# Altium schematic sheet Sortie.SchDoc
size A; SheetNumber: 1; SheetTotal: 1; SPICEModelCacheCCUHFSGS: <root> / <DocumentId>CCUHFSGS</DocumentId> / </root>
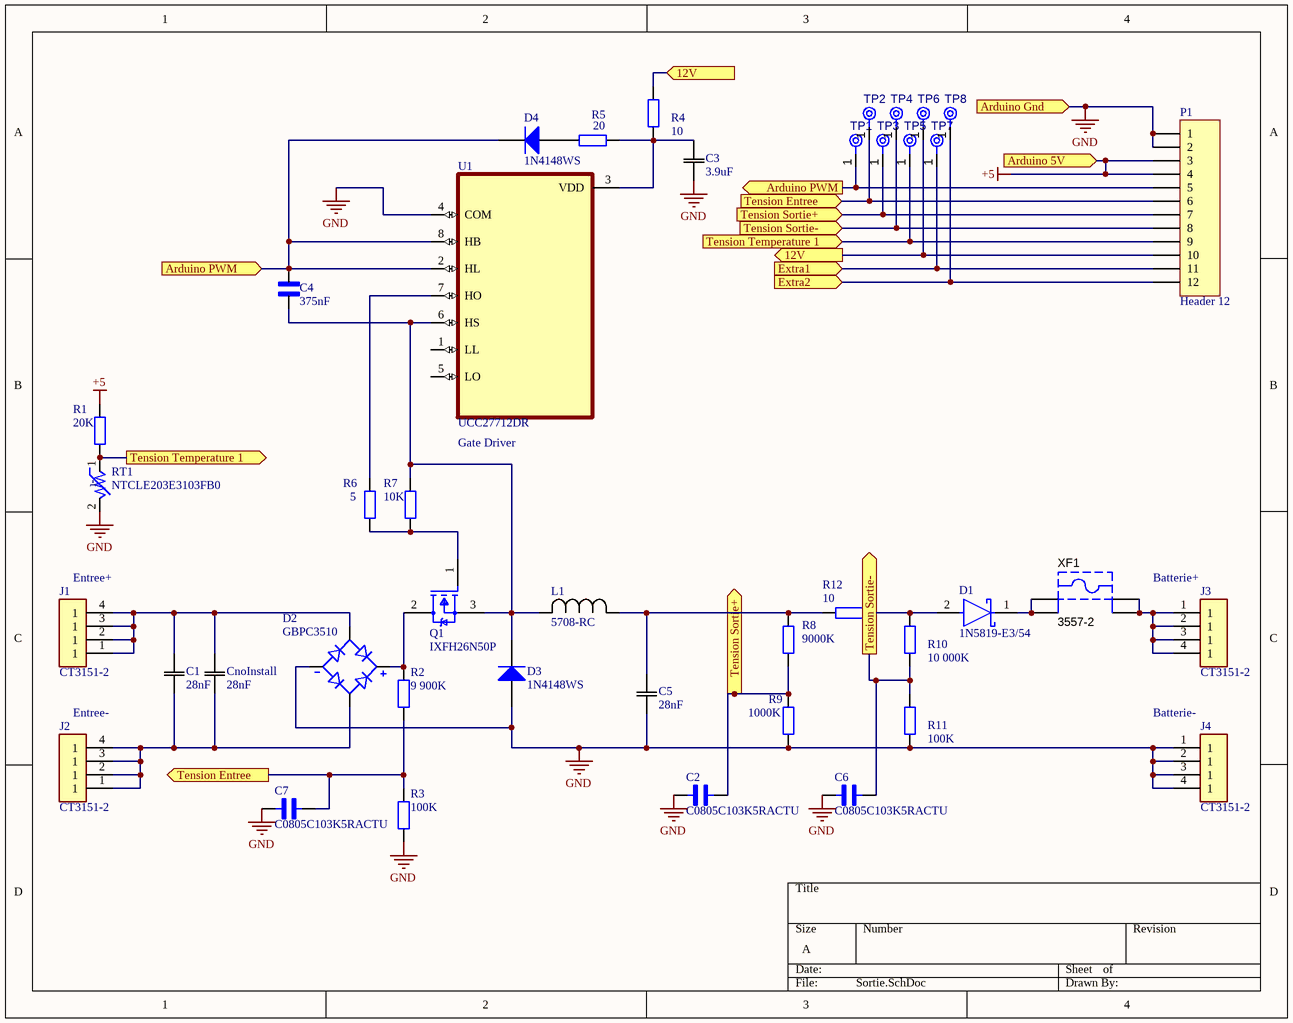
[diagram p0: Sortie.SchDoc]

## Parts
C1  28nF  [CAPC17595_95N_KEM]
C2  C0805C103K5RACTU  [CAPC2012X88N]
C3  3.9uF  [CAP_L_10X12P5_RUB]
C4  375nF  [CAPRB500W50L550T350H600]
C5  28nF  [CAPC17595_95N_KEM]
C6  C0805C103K5RACTU  [CAPC2012X88N]
C7  C0805C103K5RACTU  [CAPC2012X88N]
CnoInstall  28nF  [CAPC17595_95N_KEM]
D1  1N5819-E3/54  [FP-1N5819-E3-54-MFG]
D2  GBPC3510  [DIOB_GBPC3510]
D3  1N4148WS  [FAIR-SOD-323_V]
D4  1N4148WS  [FAIR-SOD-323_V]
J1  CT3151-2  [CALTEST_CT3151-2]
J2  CT3151-2  [CALTEST_CT3151-2]
J3  CT3151-2  [CALTEST_CT3151-2]
J4  CT3151-2  [CALTEST_CT3151-2]
L1  5708-RC  [IND_BOURNS_5708]
P1  Header 12  [HDR1X12]
Q1  IXFH26N50P  [FP-PG-TO220-3-MFG]
R1  value 20K  [AXIAL-0.4]  (hidden comment: Res2)
R2  value 9 900K  [AXIAL-0.4]  (hidden comment: Res2)
R3  value 100K  [AXIAL-0.4]  (hidden comment: Res2)
R4  value 10  [AXIAL-0.4]  (hidden comment: Res2)
R5  value 20  [AXIAL-0.4]  (hidden comment: Res2)
R6  value 5  [AXIAL-0.4]  (hidden comment: Res2)
R7  value 10K  [AXIAL-0.4]  (hidden comment: Res2)
R8  value 9000K  [AXIAL-0.4]  (hidden comment: Res2)
R9  value 1000K  [AXIAL-0.4]  (hidden comment: Res2)
R10  value 10 000K  [AXIAL-0.4]  (hidden comment: Res2)
R11  value 100K  [AXIAL-0.4]  (hidden comment: Res2)
R12  value 10  [AXIAL-0.4]  (hidden comment: Res2)
RT1  NTCLE203E3103FB0  [VARRB254W40L360T300H900]
TP1  TPAD6R  [TP06R]  (value not drawn)  (no BOM)
TP2  TPAD6R  [TP06R]  (value not drawn)  (no BOM)
TP3  TPAD6R  [TP06R]  (value not drawn)  (no BOM)
TP4  TPAD6R  [TP06R]  (value not drawn)  (no BOM)
TP5  TPAD6R  [TP06R]  (value not drawn)  (no BOM)
TP6  TPAD6R  [TP06R]  (value not drawn)  (no BOM)
TP7  TPAD6R  [TP06R]  (value not drawn)  (no BOM)
TP8  TPAD6R  [TP06R]  (value not drawn)  (no BOM)
U1  UCC27712DR  [SOIC127P599X175-8N]
XF1  3557-2  [KSTN-3557-2]

## Ports
12V (in, see Sortie[3A]), 12V (out, see Sortie[3A]), Arduino 5V (in), Arduino Gnd (in), Arduino PWM (in, see Sortie[3A]), Arduino PWM (out, see Sortie[1B]), Extra1 (in), Extra2 (in), Tension Entree (in, see Sortie[1D]), Tension Entree (out, see Sortie[3A]), Tension Sortie+ (in, see Sortie[3C]), Tension Sortie+ (out, see Sortie[3A]), Tension Sortie- (in, see Sortie[3C]), Tension Sortie- (out, see Sortie[3A]), Tension Temperature 1 (in, see Sortie[1B]), Tension Temperature 1 (out, see Sortie[3A])

## Nets
+5: P1.3 P1.4 R1.2 ; port Arduino 5V
GND: C2.2 C3.1 C5.1 C6.2 C7.2 D2.NEG D3.1(A) J4.1 J4.2(1) J4.3(1) J4.4(1) P1.1 P1.2 R3.1 R9.1 R11.2 RT1.2 U1.4(COM) ; port Arduino Gnd
12V: P1.10 R4.1 TP6.1(TP) ; port 12V
Arduino PWM: C4.2 D4.2(K) P1.5 TP1.1(TP) U1.2(HL) U1.8(HB) ; port Arduino PWM
Extra1: P1.11 TP7.1(TP) ; port Extra1
Extra2: P1.12 TP8.1(TP) ; port Extra2
Tension Entree: C7.1 P1.6 R2.1 R3.2 TP2.1(TP) ; port Tension Entree
Tension Sortie+: C2.1 P1.7 R8.2 R9.2 TP3.1(TP) ; port Tension Sortie+
Tension Sortie-: C6.1 P1.8 R10.2 R11.1 TP4.1(TP) ; port Tension Sortie-
Tension Temperature 1: P1.9 R1.1 RT1.1 TP5.1(TP) ; port Tension Temperature 1
NetC1_1: C1.1 CnoInstall.1 D2.AC1 J2.1 J2.2(1) J2.3(1) J2.4(1)
NetC1_2: C1.2 CnoInstall.2 D2.AC2 J1.1 J1.2(1) J1.3(1) J1.4(1)
NetC3_2: C3.2 R4.2 R5.2 U1.3(VDD)
NetC4_1: C4.1 D3.2(K) L1.2 Q1.3(SOURCE) R7.2 U1.6(HS)
NetC5_2: C5.2 L1.1 R8.1 R12.2
NetD1_1: D1.1(C) XF1.1 XF1.2
NetD1_2: D1.2(A) R10.1 R12.1
NetD2_POS: D2.POS Q1.2(DRAIN) R2.2
NetD4_1: D4.1(A) R5.1
NetJ3_1: J3.1 J3.2(1) J3.3(1) J3.4(1) XF1.3 XF1.4
NetQ1_1: Q1.1(GATE) R6.1 R7.1
NetR6_2: R6.2 U1.7(HO)

Not connected (* = marked no-connect by the designer): U1 1(LL) 5(LO)

## Notes on the sheet
- Gate Driver
- (near J1) Entree+
- Batterie+
- (near J2) Entree-
- (near J4) Batterie-
- (in symbol NTCLE203E3103FB0) -t

## Library data of the parts
C1 C5 CnoInstall = C0603C473K5RACTU: SMD Comm X7R, Ceramic, 0.047 uF, 10%, 50 VDC, X7R, SMD, MLCC, Temperature Stable, Class II, 0603; Manufacturer_Name: Kemet; Copyright: Copyright (C) 2026 Ultra Librarian. All rights reserved.; Manufacturer_Part_Number: C0603C473K5RACTU
C2 C6 C7 = C0805C103K5RACTU: Capacitor;Ceramic;Cap;.010uF;Tol+10%;SMT;Vol-Rtg 50V;X7R;TR | KEMET C0805C103K5RACTU; SnapEDA_Link: https://www.snapeda.com/parts/C0805C103K5RACTU/KEMET/view-part/?ref=snap; Package: 805-2 KEMET; Value: *; MF: KEMET; MP: C0805C103K5RACTU; Check_prices: https://www.snapeda.com/parts/C0805C103K5RACTU/KEMET/view-part/?ref=eda
C3 = 400LEX3.9MEFC10X12.5: No Description Available; Manufacturer_Name: Rubycon; Copyright: Copyright (C) 2026 Ultra Librarian. All rights reserved.; Manufacturer_Part_Number: 400LEX3.9MEFC10X12.5
C4 = FG26X7R1E106KRT00: Cap Ceramic 10uF 25V X7R 10% Radial 5mm 125C; MF: TDK; SnapEDA_Link: https://www.snapeda.com/parts/FG26X7R1E106KRT00/TDK/view-part/?ref=snap; Package: Radial TDK; Value: *; MP: FG26X7R1E106KRT00; Check_prices: https://www.snapeda.com/parts/FG26X7R1E106KRT00/TDK/view-part/?ref=eda
D1 = CMP-02539-000037-2: DIODE SCHOTTKY 40V 1A DO204AL; Capacitance: 110pF; Element Configuration: Single; Peak Non-Repetitive Surge Current: 25A; Forward Voltage: 900mV; Polarity: Standard; Peak Reverse Current: 1mA; Max Operating Temperature: 125°C; Forward Current: 1A; Package Quantity: 1; Average Rectified Current: 1A; Voltage: 40V; Radiation Hardening: No; Current: 1A; Max Reverse Voltage (DC): 40V; Height: 2.7mm; Output Current: 1A; Lead Free: Lead Free; Diameter: 2.7mm; Min Operating Temperature: -65°C; Max Repetitive Reverse Voltage (Vrrm): 40V; Number of Pins: 2; Width: 2.7mm; Length: 5.2mm; Current Rating: 1A; Packaging: Tape and Reel; Mount: Through Hole; Max Forward Surge Current (Ifsm): 25A; Voltage Rating (DC): 40V
D2 = GBPC3510: Bridge Rectifier Single Phase Standard 1kV QC Terminal GBPC; MF: Fairchild Semiconductor; Package: 4-4 Fairchild Semiconductor; Purchase-URL: https://pricing.snapeda.com/search/part/GBPC3510/?ref=eda; MP: GBPC3510; SnapEDA_Link: https://www.snapeda.com/parts/GBPC3510/Fairchild+Semiconductor/view-part/?ref=snap; Value: *; Availability: In Stock; Price: None; Check_prices: https://www.snapeda.com/parts/GBPC3510/Fairchild+Semiconductor/view-part/?ref=eda
D3 D4 = CMP-004-00001-2: Small Signal Diode, 75 V, 0.15 A, -55 to 150 degC, 2-Pin SOD-323, RoHS, Tape and Reel; Manufacturer: Fairchild; Recovery Time: 4ns; Forward Voltage: 1V; Peak Reverse Current: 5uA; Forward Current: 150mA; Capacitance: -323f; Datasheet URL: https://www.fairchildsemi.com/datasheets/1N/1N4148WS.pdf; Package Reference: SOD-323; Package Description: 2-Pin Small Outline Diode Flat Lead, Body 1.7 x 1.25 mm; Case/Package: SOD-323; Mounting Technology: SM; Manufacturer URL: https://www.fairchildsemi.com/; Pins: 2; Packaging: TapeandReel; Package Quantity: 3000; Min Operating Temperature: -55°C; RoHS Compliant: True; Max Operating Temperature: 150°C; Datasheet Version: Rev. 1.2, 03/2015
J1-J4 = CT3151-2: Banana Jack Connector Standard Banana Solder Red; MF: Cal Test; SnapEDA_Link: https://www.snapeda.com/parts/CT3151-2/Cal+Test+Electronics/view-part/?ref=snap; Package: None; Value: *; MP: CT3151-2; Check_prices: https://www.snapeda.com/parts/CT3151-2/Cal+Test+Electronics/view-part/?ref=eda
L1 = 5708-RC: 0.4mH; Manufacturer_Name: Bourns Electronics; Copyright: Copyright (C) 2026 Ultra Librarian. All rights reserved.; Manufacturer_Part_Number: 5708-RC
P1 = Header 12: Header, 12-Pin; LatestRevisionDate: 17-Jul-2002; LatestRevisionNote: Re-released for DXP Platform.; Publisher: Altium Limited
Q1 = CMP-32901-000547-1: MOSFET N-CH 55V 29A TO220AB; Rise Time: 49ns; Turn-On Delay Time: 7ns; Input Capacitance: 700pF; Drain to Source Resistance: 40mR; Turn-Off Delay Time: 31ns; Power Dissipation: 68W; Gate to Source Voltage (Vgs): 20V; Element Configuration: Single; Threshold Voltage: 4V; Packaging: Rail/Tube; Number of Pins: 3; Height: 0.6inch; Case/Package: TO-220; Min Operating Temperature: -55°C; Max Operating Temperature: 175°C; RoHS Compliant: Yes; Width: 0.185inch; Lead Free: Lead Free; Contact Plating: Tin; Drain to Source Breakdown Voltage: 55V; Length: 0.414inch; Mount: Through Hole; Max Power Dissipation: 68W; Halogen Free: Not Halogen Free; Max Dual Supply Voltage: 55V; Rds On Max: 40mR; Continuous Drain Current (ID): 29A; Drain to Source Voltage (Vdss): 55V; REACH SVHC: No SVHC
R1-R12 = Res2: Resistor; LatestRevisionDate: 17-Jul-2002; LatestRevisionNote: Re-released for DXP Platform.; PackageDescription: Axial Device, Thru-Hole; 2 Leads; 0.4 in Pin Spacing; PackageReference: AXIAL-0.4; Published: 8-Jun-2000; Publisher: Altium Limited
RT1 = NTCLE203E3103FB0: NTC Thermistors,NTC Ni 0.4 lead 10K 1% bulk e3 | Vishay Dale NTCLE203E3103FB0; SnapEDA_Link: https://www.snapeda.com/parts/NTCLE203E3103FB0/Vishay/view-part/?ref=snap; Package: None; Value: *; MF: Vishay; MP: NTCLE203E3103FB0; Check_prices: https://www.snapeda.com/parts/NTCLE203E3103FB0/Vishay/view-part/?ref=eda
TP1-TP8 = CMP-00028-00002-2: 0.6mm round; Pins: 1
U1 = UCC27712DR: 1.8-A/2.8-A, 620V half bridge driver with interlock; MF: Texas Instruments; SnapEDA_Link: https://www.snapeda.com/parts/UCC27712DR/Texas+Instruments/view-part/?ref=snap; Package: SOIC-8 Texas Instruments; Value: *; MP: UCC27712DR; Check_prices: https://www.snapeda.com/parts/UCC27712DR/Texas+Instruments/view-part/?ref=eda
XF1 = CMP-2000-05461-1: FUSE HOLDER, PCB MOUNT, 500VAC, 20A, ROHS; Manufacturer: Keystone-Electronics; Number of Circuits: 1; Voltage: 500V; Fuseholder Type: Block; Fuse Type: Blade; Fuse Size: 0.43"Lx0.15"Wx0.64"H(10.92mmx3.81mmx16.25mm); For Use With/Related Products: ATC,ATO257,MINI897; Current Rating: 30A; Datasheet URL: http://datasheet.octopart.com/3557-2-Keystone-datasheet-15715937.pdf; Orientation: Vertical; Family: Fuseholders; Datasheet Version: Apr-13; Contact Finish: TinNickel; Mounting Type: PCB; Series: -; Category: CircuitProtection; Termination Style: PCPin; Contact Material: Brass; Manufacturer URL: http://www.keyelco.com/